# Altium schematic sheet DEVICE2.SchDoc: Explorer STM32F407 Board
size A4; Author: ATOM@ALIENTEK; Revision: V3.4; SheetSize: A4
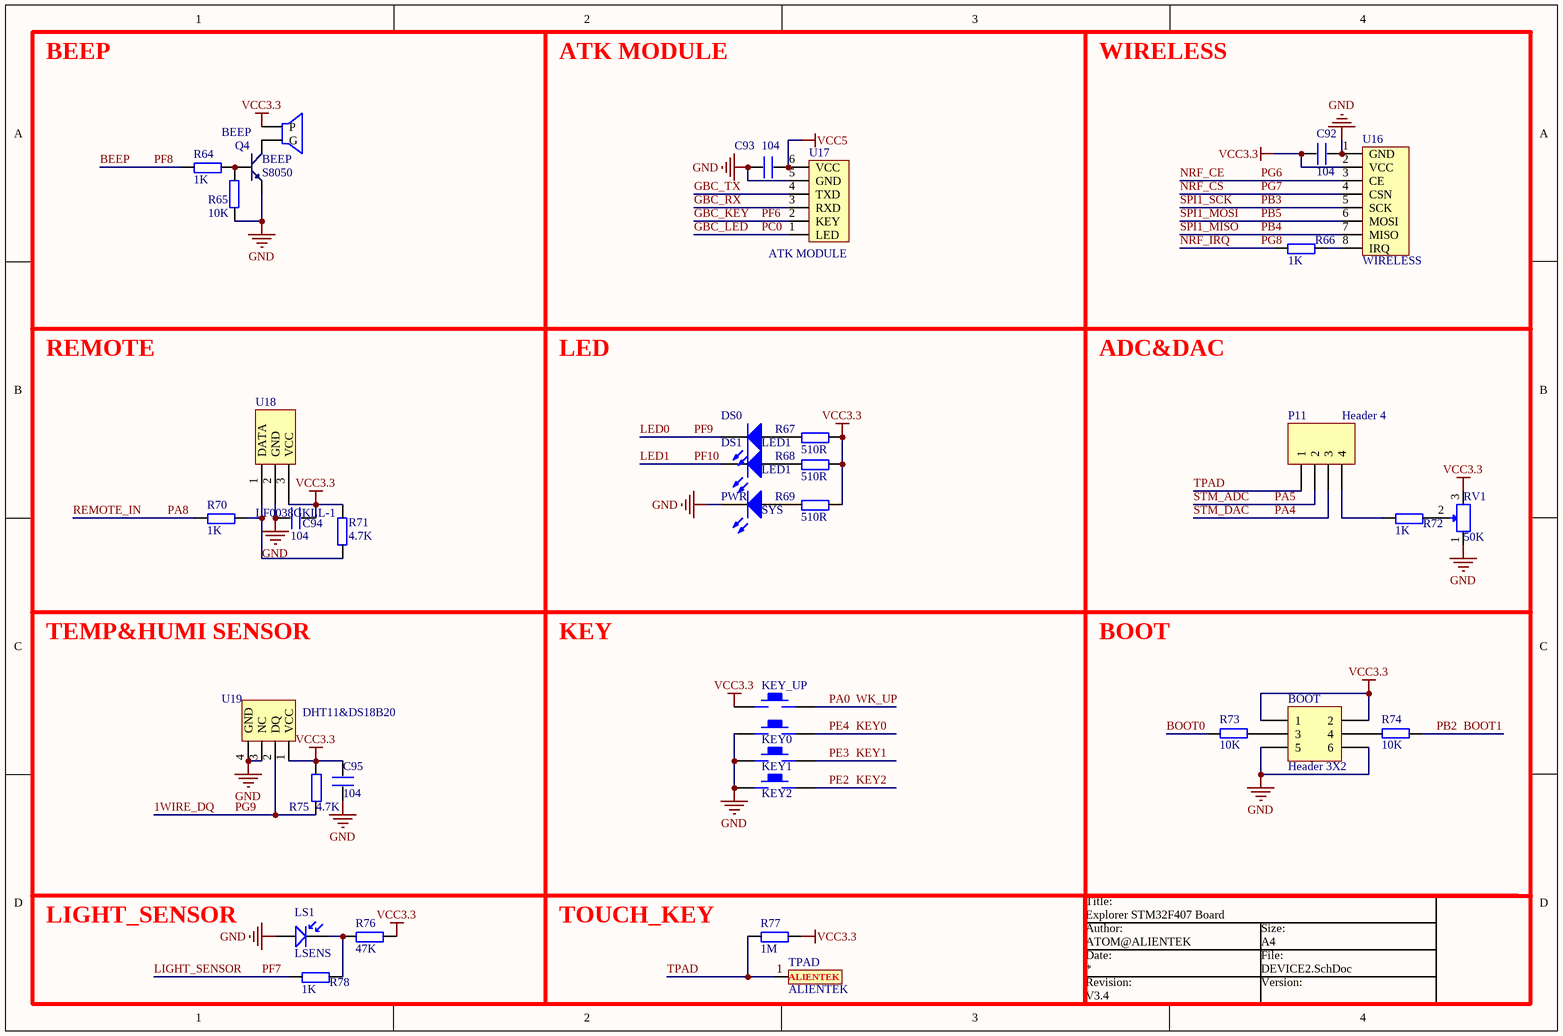
[diagram p0: DEVICE2.SchDoc]

## Parts
BEEP  BEEP  [BELL-5]
BOOT  Header 3X2  [HDR2X3]
C92  104  [0402]
C93  104  [0402]
C94  104  [0402]
C95  104  [0402]
DS0  LED1  [SMDLED]
DS1  LED1  [SMDLED]
KEY0  KEY_M  [KEY_M]  (value not drawn)
KEY1  KEY_M  [KEY_M]  (value not drawn)
KEY2  KEY_M  [KEY_M]  (value not drawn)
KEY_UP  KEY_M  [KEY_M]  (value not drawn)
LS1  LSENS  [SMDLED]
P11  Header 4  [HDR1X4]
PWR  SYS  [SMDLED]
Q4  S8050  [SOT-23R]
R64  1K  [0402]
R65  10K  [0402]
R66  1K  [0402]
R67  510R  [0402]
R68  510R  [0402]
R69  510R  [0402]
R70  1K  [0402]
R71  4.7K  [0402]
R72  1K  [0402]
R73  10K  [0402]
R74  10K  [0402]
R75  4.7K  [0402]
R76  47K  [0402]
R77  1M  [0402]
R78  1K  [0402]
RV1  50K  [RV]
TPAD  ALIENTEK  [ATK_TPAD]
U16  WIRELESS  [NRF24L01]
U17  ATK MODULE  [HEAD6]
U18  LF0038GKLL-1  [IR-LF0038GKLL-1]
U19  DHT11&DS18B20  [DHT11]

## Nets
GND: BOOT.5 BOOT.6 C92.1 C93.2 C94.2 C95.2 KEY0.1 KEY1.1 KEY2.1 LS1.1 PWR.2(K) Q4.1(E) R65.2 RV1.1 U16.1(GND) U17.5(GND) U18.2(GND) U19.3(NC) U19.4(GND)
VCC3.3: BEEP.1(P) BOOT.1 BOOT.2 C92.2 C94.1 C95.1 KEY_UP.1 R67.2 R68.2 R69.2 R71.1 R75.2 R76.2 R77.2 RV1.3 U16.2(VCC) U18.3(VCC) U19.1(VCC)
VCC5: C93.1 U17.6(VCC)
1WIRE_DQ: R75.1 U19.2(DQ)  [also labelled PG9]
BEEP: R64.1  [also labelled PF8]
BOOT0: R73.2
BOOT1: R74.1  [also labelled PB2]
GBC_KEY: U17.2(KEY)  [also labelled PF6]
GBC_LED: U17.1(LED)  [also labelled PC0]
GBC_RX: U17.3(RXD)
GBC_TX: U17.4(TXD)
KEY0: KEY0.2  [also labelled PE4]
KEY1: KEY1.2  [also labelled PE3]
KEY2: KEY2.2  [also labelled PE2]
LED0: DS0.2(K)  [also labelled PF9]
LED1: DS1.2(K)  [also labelled PF10]
LIGHT_SENSOR: R78.1  [also labelled PF7]
NRF_CE: U16.3(CE)  [also labelled PG6]
NRF_CS: U16.4(CSN)  [also labelled PG7]
NRF_IRQ: R66.1  [also labelled PG8]
PA0: KEY_UP.2  [also labelled WK_UP]
PA4: P11.3  [also labelled STM_DAC]
PA5: P11.2  [also labelled STM_ADC]
PA8: R70.1  [also labelled REMOTE_IN]
PB3: U16.5(SCK)  [also labelled SPI1_SCK]
PB4: U16.7(MISO)  [also labelled SPI1_MISO]
PB5: U16.6(MOSI)  [also labelled SPI1_MOSI]
TPAD: P11.1 R77.1 TPAD.1
NetBEEP_2: BEEP.2(G) Q4.3(C)
NetBOOT_3: BOOT.3 R73.1
NetBOOT_4: BOOT.4 R74.2
NetDS0_1: DS0.1(A) R67.1
NetDS1_1: DS1.1(A) R68.1
NetLS1_2: LS1.2 R76.1 R78.2
NetP11_4: P11.4 R72.1
NetPWR_1: PWR.1(A) R69.1
NetQ4_2: Q4.2(B) R64.2 R65.1
NetR66_2: R66.2 U16.8(IRQ)
NetR70_2: R70.2 R71.2 U18.1(DATA)
NetR72_2: R72.2 RV1.2

## Notes on the sheet
- BEEP
- ATK MODULE
- WIRELESS
- REMOTE
- LED
- ADC&DAC
- TEMP&HUMI SENSOR
- KEY
- BOOT
- LIGHT_SENSOR
- TOUCH_KEY
- Title:
- Author:
- Date:
- Revision:
- Size:
- File:
- Version:

## Library data of the parts
BOOT = Header 3X2: Header, 3-Pin, Dual row; LatestRevisionDate: 17-Jul-2002; LatestRevisionNote: Re-released for DXP Platform.; Publisher: Altium Limited
C92-C95 = C
DS0 DS1 PWR = LED2: Typical RED, GREEN, YELLOW, AMBER GaAs LED; Published: 8-Jun-2000; LatestRevisionDate: 17-Jul-2002; LatestRevisionNote: Re-released for DXP Platform.; PackageDocument: Feb-2002; PackageReference: 3.2X1.6X1.1; Publisher: Altium Limited
LS1 = LSENS: LIGHT SENS
P11 = Header 4: Header, 4-Pin; LatestRevisionDate: 17-Jul-2002; LatestRevisionNote: Re-released for DXP Platform.; Publisher: Altium Limited
Q4 = NPN: 8050/BCW846/BCW847
R64-R78 = R
RV1 = RV
U16 = NRF24L01
U17 = ATK-HC05
U18 = HS0038
U19 = DHT11: 数字温湿度传感器